# Altium schematic sheet Sheet1.SchDoc
size A3; SheetNumber: 1; SheetTotal: 1; SPICEModelCacheIPQADEEA: <root> / <DocumentId>IPQADEEA</DocumentId> / <CacheFrame Number="0"> / <Model Name="diode" Kind="MDL"> / <Text>*Default Diode / *Diode Pinout: A,K / .MODEL DIODE D()</Text> / </Model> / <Model Name="irf9510" Kind="CKT"> / <Text>*IRF9510  MCE  4-2-96 / *100V  4A  1.2 ohms HEXFET pkg:TO-220 2,1,3 / .SUBCKT IRF9510  10 20 40 40 / M1   1  2  3  3  DMOS L=1U W=1U / RD  10  1  .569 / RS  30  3  31M / RG  20  2  37.5 / CGS  2  3  182P / EGD 12  0  1  2  1 / VFB 14  0  0 / FFB  1  2  VFB  1 / CGD 13 14  231P / R1  13  0  1 / D1  12 13  DLIM / DDG 15 14  DCGD / R2  12 15  1 / D2  15  0  DLIM / DSD 10  3  DSUB / LS  30 40  7.5N / .MODEL DMOS PMOS (LEVEL=3 THETA=60M VMAX=208K ETA=2M VTO=-3 KP=.471) / .MODEL DCGD D (CJO=231P VJ=.6 M=.68) / .MODEL DSUB D (IS=16.6N N=1.5 RS=1.18 BV=100 CJO=327P VJ=.8 M=.42 TT=82N) / .MODEL DLIM D (IS=100U) / .ENDS IRF9510</Text> / </Model> / <Model Name="led0" Kind="MDL"> / <Text>*Typ INFRARED GaAs LED: Vf=1.2V Vr=5V If=40mA trr=3uS / *LED Pinout: 1=A, 2=K / .MODEL LED0 D (IS=93.5P RS=84M N=2.63 BV=5 IBV=10U / + CJO=2.97P VJ=.75 M=.333 TT=4.32U)</Text> / </Model> / </CacheFrame> / </root>
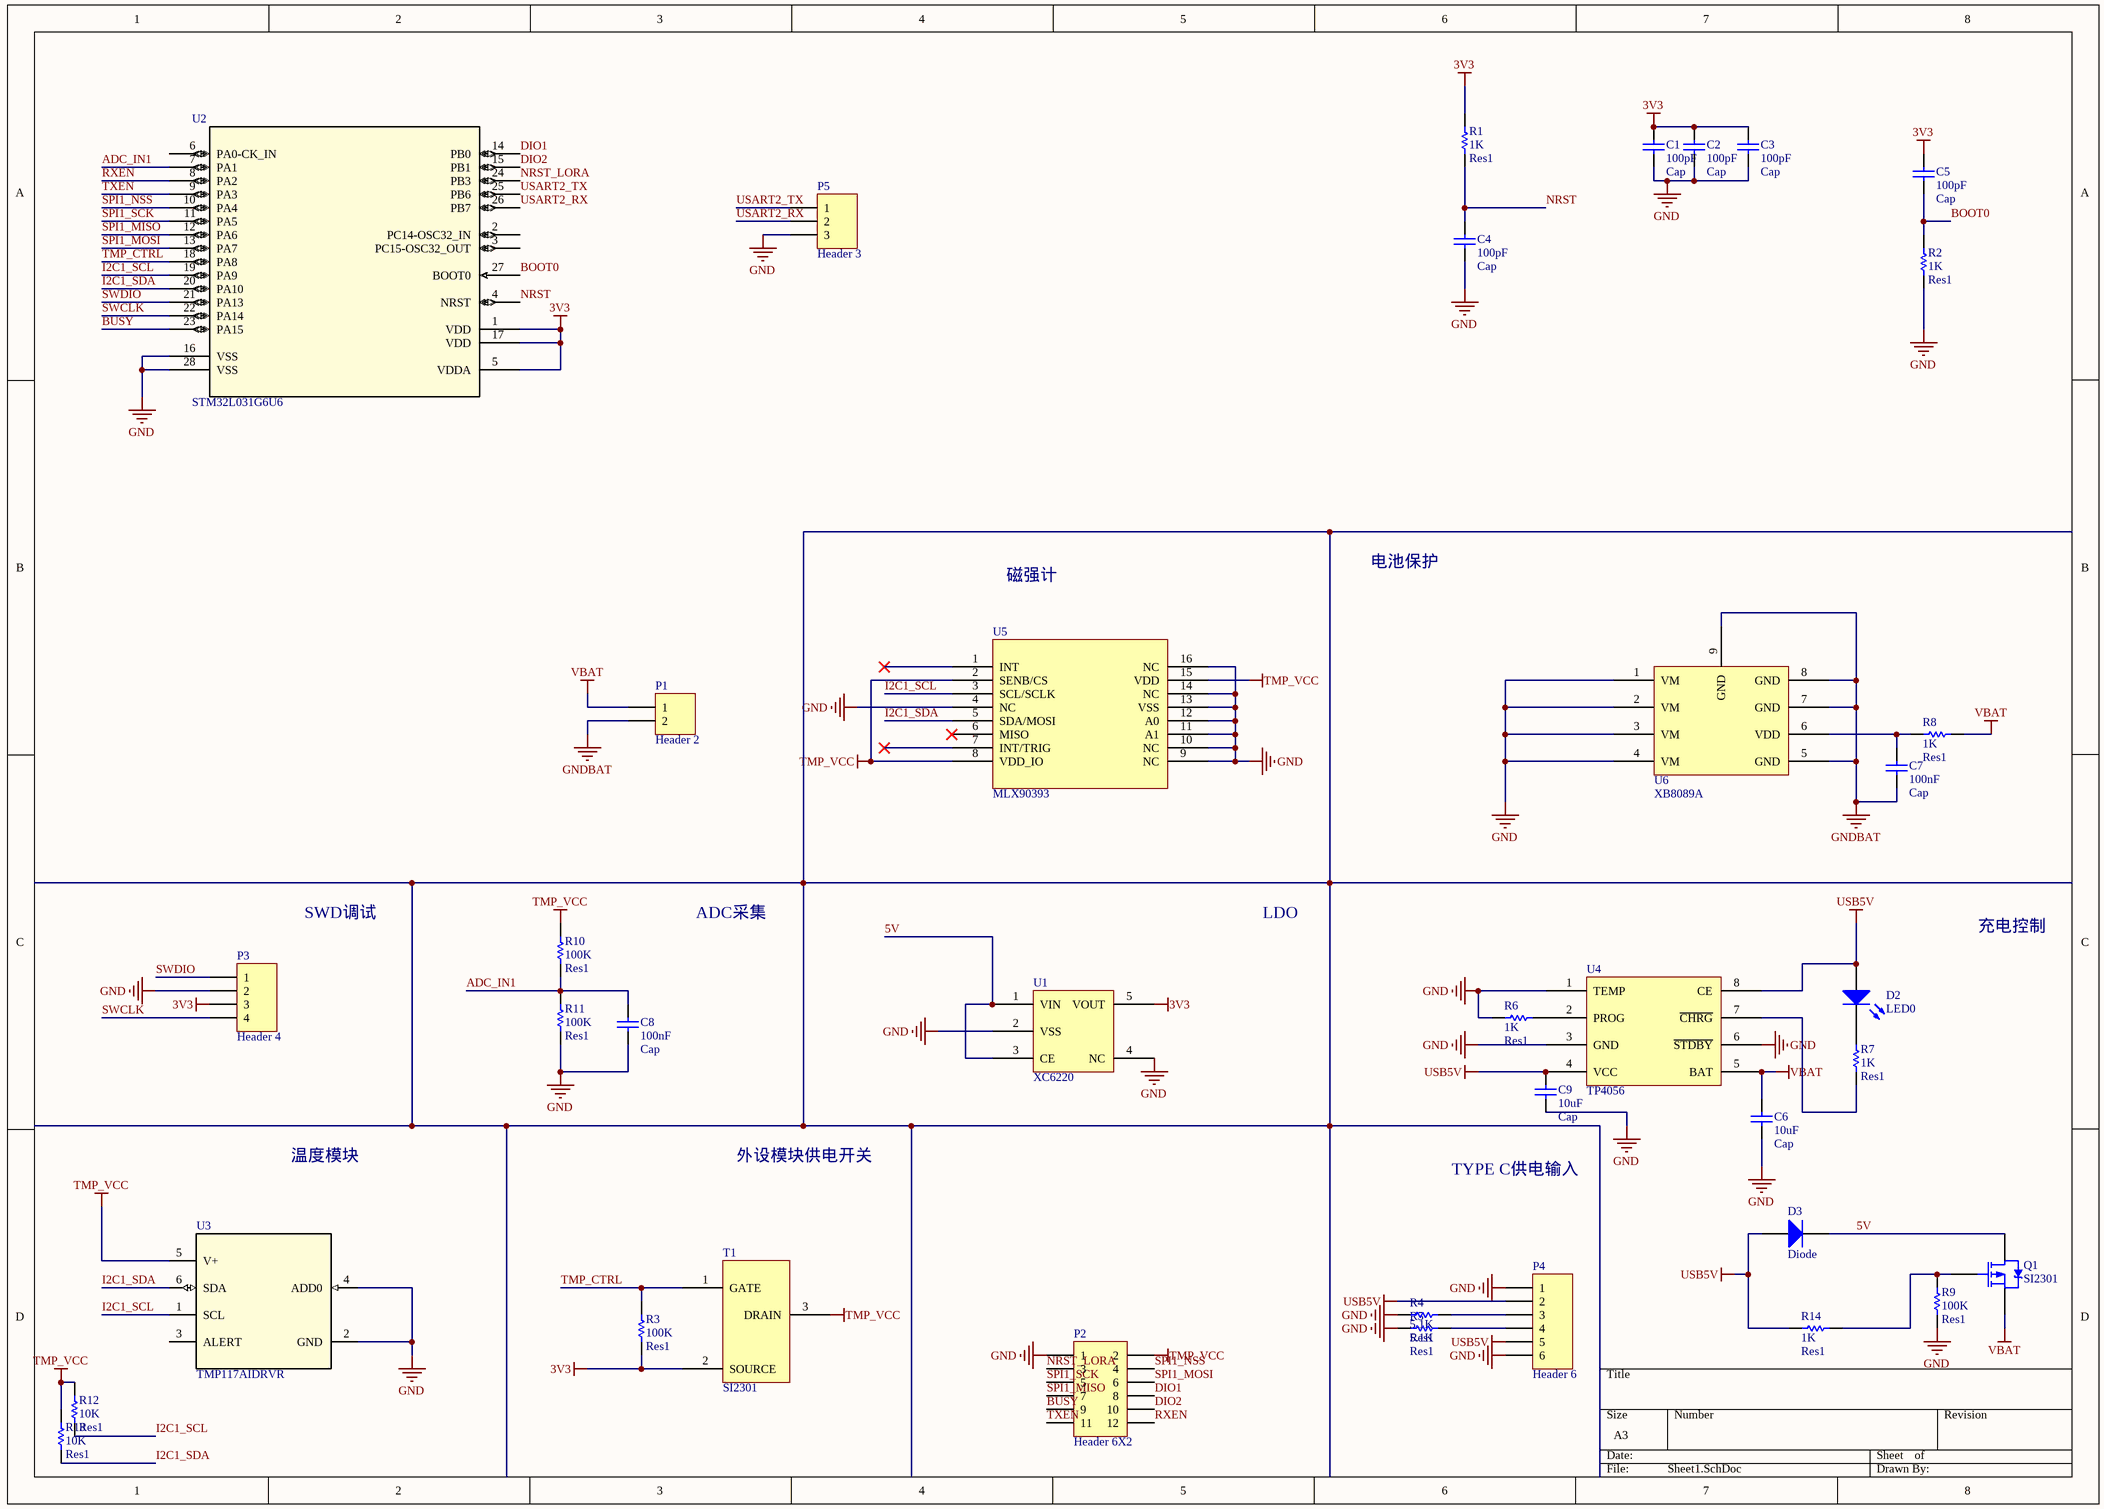
[diagram p0: Sheet1.SchDoc]

## Parts
C1  Cap  value 100pF  [1608(0603)_C]
C2  Cap  value 100pF  [1608(0603)_C]
C3  Cap  value 100pF  [1608(0603)_C]
C4  Cap  value 100pF  [1608(0603)_C]
C5  Cap  value 100pF  [1608(0603)_C]
C6  Cap  value 10uF  [1608(0603)_C]
C7  Cap  value 100nF  [1608(0603)_C]
C8  Cap  value 100nF  [1608(0603)_C]
C9  Cap  value 10uF  [1608(0603)_C]
D2  LED0  [0603_LED]
D3  Diode  [0603_Diode]
P1  Header 2  [HDR1X2]
P2  Header 6X2  [HDR2X6]
P3  Header 4  [HDR1X4]
P4  Header 6  [Type_C-6P]
P5  Header 3  [HDR1X3]
Q1  SI2301  [SI2301]
R1  Res1  value 1K  [1608(0603)_R]
R2  Res1  value 1K  [1608(0603)_R]
R3  Res1  value 100K  [1608(0603)_R]
R4  Res1  value 5.1K  [1608(0603)_R]
R5  Res1  value 5.1K  [1608(0603)_R]
R6  Res1  value 1K  [1608(0603)_R]
R7  Res1  value 1K  [1608(0603)_R]
R8  Res1  value 1K  [1608(0603)_R]
R9  Res1  value 100K  [1608(0603)_R]
R10  Res1  value 100K  [1608(0603)_R]
R11  Res1  value 100K  [1608(0603)_R]
R12  Res1  value 10K  [1608(0603)_R]
R13  Res1  value 10K  [1608(0603)_R]
R14  Res1  value 1K  [1608(0603)_R]
T1  SI2301  [SI2301]
U1  XC6220  [XC6220]
U2  STM32L031G6U6  [UFQFPN28-4x4mm-M]
U3  TMP117AIDRVR  [DRV0006B]
U4  TP4056  [TP4056ESOP]
U5  MLX90393  [MLX90393]
U6  XB8089A  [SOP127P600X175_HS-9N]

## Nets
3V3: C1.2 C2.2 C3.2 C5.2 P3.3 R1.2 R3.1 T1.2(SOURCE) U1.5(VOUT) U2.1(VDD) U2.5(VDDA) U2.17(VDD)
GND: C1.1 C2.1 C3.1 C4.1 C6.1 C8.1 C9.1 P2.1 P3.2 P4.1 P4.6 P5.3 R2.1 R4.2 R5.2 R6.2 R9.1 R11.1 U1.2(VSS) U1.4(NC) U2.16(VSS) U2.28(VSS) U3.2(GND) U3.4(ADD0) U4.1(TEMP) U4.3(GND) U4.6(~{STDBY}) U5.4(NC) U5.9(NC) U5.10(NC) U5.11(A1) U5.12(A0) U5.13(VSS) U5.14(NC) U5.16(NC) U6.1(VM) U6.2(VM) U6.3(VM) U6.4(VM)
GNDBAT: C7.1 P1.2 U6.5(GND) U6.7(GND) U6.8(GND) U6.9(GND)
TMP_VCC: P2.2 R10.2 R12.2 R13.2 T1.3(DRAIN) U3.5(V+) U5.2(SENB/CS) U5.8(VDD_IO) U5.15(VDD)
USB5V: C9.2 D2.1(A) D3.1(A) P4.2 P4.5 R14.2 U4.4(VCC) U4.8(CE)
VBAT: C6.2 P1.1 Q1.3(S) R8.1 U4.5(BAT)
5V: D3.2(K) Q1.2(D) U1.1(VIN) U1.3(CE)
ADC_IN1: C8.2 R10.1 R11.2 U2.7(PA1)
BOOT0: C5.1 R2.2 U2.27(BOOT0)
BUSY: P2.9 U2.23(PA15)
DIO1: P2.8 U2.14(PB0)
DIO2: P2.10 U2.15(PB1)
I2C1_SCL: R12.1 U2.19(PA9) U3.1(SCL) U5.3(SCL/SCLK)
I2C1_SDA: R13.1 U2.20(PA10) U3.6(SDA) U5.5(SDA/MOSI)
NRST: C4.2 R1.1 U2.4(NRST)
NRST_LORA: P2.3 U2.24(PB3)
RXEN: P2.12 U2.8(PA2)
SPI1_MISO: P2.7 U2.12(PA6)
SPI1_MOSI: P2.6 U2.13(PA7)
SPI1_NSS: P2.4 U2.10(PA4)
SPI1_SCK: P2.5 U2.11(PA5)
SWCLK: P3.4 U2.22(PA14)
SWDIO: P3.1 U2.21(PA13)
TMP_CTRL: R3.2 T1.1(GATE) U2.18(PA8)
TXEN: P2.11 U2.9(PA3)
USART2_RX: P5.2 U2.26(PB7)
USART2_TX: P5.1 U2.25(PB6)
NetC7_2: C7.2 R8.2 U6.6(VDD)
NetD2_2: D2.2(K) R7.2
NetP4_3: P4.3 R4.1
NetP4_4: P4.4 R5.1
NetQ1_1: Q1.1(G) R9.2 R14.1
NetR6_1: R6.1 U4.2(PROG)
NetR7_1: R7.1 U4.7(~{CHRG})

Not connected (* = marked no-connect by the designer): U2 2(PC14-OSC32_IN) 3(PC15-OSC32_OUT) 6(PA0-CK_IN); U3 3(ALERT); U5 1(INT)* 6(MISO)* 7(INT/TRIG)*

## Notes on the sheet
- 磁强计
- 电池保护
- SWD调试
- ADC采集
- LDO
- 充电控制
- 温度模块
- 外设模块供电开关
- TYPE C供电输入

## Library data of the parts
C1-C9 = Cap: Capacitor; Published: 8-Jun-2000; LatestRevisionDate: 17-Jul-2002; LatestRevisionNote: Re-released for DXP Platform.; PackageReference: RAD-0.3; Publisher: Altium Limited; PackageDescription: Radial Cap, Thru-Hole; 2 Leads; 0.3 in Pin Spacing
D2 = LED0: Typical INFRARED GaAs LED; Published: 8-Jun-2000; LatestRevisionDate: 08-Jul-2005; LatestRevisionNote: Mech Layer 1 removed.; PackageReference: LED-0; Publisher: Altium Limited; PackageDescription: LED; 2 Leads
D3 = Diode: Default Diode; Published: 8-Jun-2000; LatestRevisionDate: 17-Jul-2002; LatestRevisionNote: Re-released for DXP Platform.; PackageVersion: Sep-1996; PackageReference: SMC; Publisher: Altium Limited; PackageDescription: DO-214-AB/SMC; 2 C-Bend Leads; Body 7.9 x 5.9 mm, inc. leads (LxW); Code_JEDEC: DO-214-AB
P1 = Header 2: Header, 2-Pin; LatestRevisionDate: 17-Jul-2002; LatestRevisionNote: Re-released for DXP Platform.; Publisher: Altium Limited
P2 = Header 6X2: Header, 6-Pin, Dual row; LatestRevisionDate: 17-Jul-2002; LatestRevisionNote: Re-released for DXP Platform.; Publisher: Altium Limited
P3 = Header 4: Header, 4-Pin; LatestRevisionDate: 17-Jul-2002; LatestRevisionNote: Re-released for DXP Platform.; Publisher: Altium Limited
P4 = Header 6: Header, 6-Pin; LatestRevisionDate: 17-Jul-2002; LatestRevisionNote: Re-released for DXP Platform.; Publisher: Altium Limited
P5 = Header 3: Header, 3-Pin; LatestRevisionDate: 17-Jul-2002; LatestRevisionNote: Re-released for DXP Platform.; Publisher: Altium Limited
Q1 = PMOS-2: P-Channel Power MOSFET; Note: Pin 4 not drawn and electrically connected to Pin 2.; Published: 8-Jun-2000; LatestRevisionDate: 17-Jul-2002; LatestRevisionNote: Re-released for DXP Platform.; DatasheetVersion: PD-9.390D; PackageVersion: Feb-1997; PackageReference: TO-220AB; Publisher: Altium Limited; PackageDescription: TO, Thru-Hole, Vertical, Heatsink Mounted; 3 In-Line Leads; Pitch 2.54 mm; ComponentLink1Description: Manufacturer Link; ComponentLink1URL: http://www.irf.com/
R1-R14 = Res1: Resistor; Published: 8-Jun-2000; LatestRevisionDate: 17-Jul-2002; LatestRevisionNote: Re-released for DXP Platform.; PackageReference: AXIAL-0.3; Publisher: Altium Limited; PackageDescription: Axial Device, Thru-Hole; 2 Leads; 0.3 in Pin Spacing
T1 U1 U4 = Component_1
U2 = STM32L031G6U6: Ultra-low-power Arm Cortex-M0+ MCU with 32-Kbytes of Flash memory, 32 MHz CPU; Manufacturer_Name: STMicroelectronics; Copyright: Copyright (C) 2025 Ultra Librarian. All rights reserved.; Manufacturer_Part_Number: STM32L031G6U6; RefDes: RefDes; Type: Type
U3 = TMP117AIDRVR: 0.1Â°C digital temperature sensor, 48-bit EEPROM, PT100/PT1000 RTD replacement 6-WSON -55 to 150; Manufacturer_Name: Texas Instruments; TYPE: TYPE; RefDes: RefDes; Copyright: Copyright (C) 2026 Ultra Librarian. All rights reserved.; Manufacturer_Part_Number: TMP117AIDRVR